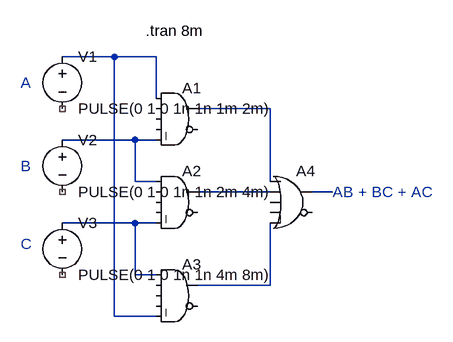
[diagram p0: schematic chemical tank.asc]
chemical tank.asc, the LTspice schematic file:
Version 4.1
SHEET 1 880 680
WIRE 64 96 -16 96
WIRE 128 96 64 96
WIRE 128 160 128 96
WIRE 304 176 192 176
WIRE 96 224 -16 224
WIRE 128 224 96 224
WIRE 96 288 96 224
WIRE 128 288 96 288
WIRE 304 288 304 176
WIRE 304 304 192 304
WIRE 400 304 368 304
WIRE 96 352 -16 352
WIRE 128 352 96 352
WIRE 96 432 96 352
WIRE 128 432 96 432
WIRE 304 448 304 352
WIRE 304 448 192 448
WIRE 64 496 64 96
WIRE 128 496 64 496
SYMBOL voltage -16 208 R0
WINDOW 123 0 0 Left 0
WINDOW 39 0 0 Left 0
SYMATTR InstName V2
SYMATTR Value PULSE(0 1 0 1n 1n 2m 4m)
SYMBOL voltage -16 336 R0
WINDOW 123 0 0 Left 0
WINDOW 39 0 0 Left 0
SYMATTR InstName V3
SYMATTR Value PULSE(0 1 0 1n 1n 4m 8m)
SYMBOL voltage -16 80 R0
WINDOW 123 0 0 Left 0
WINDOW 39 0 0 Left 0
SYMATTR InstName V1
SYMATTR Value PULSE(0 1 0 1n 1n 1m 2m)
SYMBOL Digital\\and 160 128 R0
SYMATTR InstName A1
SYMBOL Digital\\and 160 256 R0
SYMATTR InstName A2
SYMBOL Digital\\and 160 400 R0
SYMATTR InstName A3
SYMBOL Digital\\or 336 256 R0
SYMATTR InstName A4
TEXT 112 56 Left 2 !.tran 8m
TEXT -80 136 Left 2 ;A
TEXT -80 264 Left 2 ;B
TEXT -80 384 Left 2 ;C
TEXT 400 304 Left 2 ;AB + BC + AC

The netlist it stands for:
* chemical tank.asc
V2 N003 NC_01 PULSE(0 1 0 1n 1n 2m 4m)
V3 N006 NC_02 PULSE(0 1 0 1n 1n 4m 8m)
V1 N001 NC_03 PULSE(0 1 0 1n 1n 1m 2m)
A1 N001 0 0 0 N003 0 N002 0 AND
A2 N003 0 0 0 N006 0 N004 0 AND
A3 N006 0 0 0 N001 0 N007 0 AND
A4 N002 N004 0 0 N007 0 N005 0 OR
.tran 8m
* A
* B
* C
* AB + BC + AC
.backanno
.end